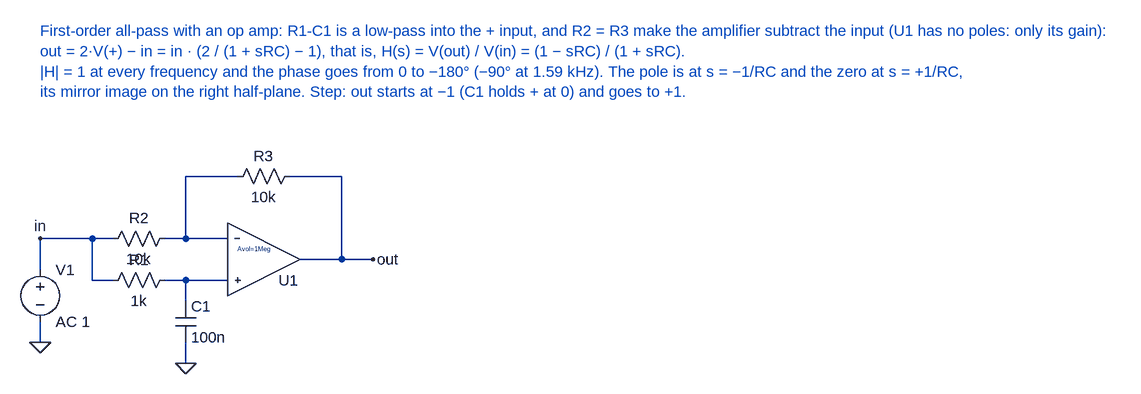
[diagram p0: schematic ap1.asc]
ap1.asc, the LTspice schematic file:
Version 4
SHEET 1 1200 800
WIRE 0 16 0 -32
WIRE 0 96 0 128
WIRE 0 -32 80 -32
WIRE 80 -32 112 -32
WIRE 192 -32 224 -32
WIRE 288 -32 224 -32
WIRE 224 -32 224 -128
WIRE 224 -128 304 -128
WIRE 384 -128 464 -128
WIRE 464 -128 464 0
WIRE 400 0 464 0
WIRE 464 0 512 0
WIRE 80 -32 80 32
WIRE 80 32 112 32
WIRE 192 32 224 32
WIRE 224 32 288 32
WIRE 224 32 224 64
WIRE 224 128 224 160
FLAG 0 128 0
FLAG 0 -32 in
FLAG 512 0 out
FLAG 224 160 0
SYMBOL voltage 0 0 R0
SYMATTR InstName V1
SYMATTR Value AC 1
SYMBOL res 208 -48 R90
WINDOW 0 0 56 VBottom 2
WINDOW 3 32 56 VTop 2
SYMATTR InstName R2
SYMATTR Value 10k
SYMBOL res 400 -144 R90
WINDOW 0 0 56 VBottom 2
WINDOW 3 32 56 VTop 2
SYMATTR InstName R3
SYMATTR Value 10k
SYMBOL OA_NoPole 480 -48 R0
SYMATTR InstName U1
SYMBOL res 208 16 R90
WINDOW 0 0 56 VBottom 2
WINDOW 3 32 56 VTop 2
SYMATTR InstName R1
SYMATTR Value 1k
SYMBOL cap 208 64 R0
SYMATTR InstName C1
SYMATTR Value 100n
TEXT 0 -352 Left 2 ;First-order all-pass with an op amp: R1-C1 is a low-pass into the + input, and R2 = R3 make the amplifier subtract the input (U1 has no poles: only its gain):\nout = 2·V(+) − in = in · (2 / (1 + sRC) − 1), that is, H(s) = V(out) / V(in) = (1 − sRC) / (1 + sRC).\n|H| = 1 at every frequency and the phase goes from 0 to −180° (−90° at 1.59 kHz). The pole is at s = −1/RC and the zero at s = +1/RC,\nits mirror image on the right half-plane. Step: out starts at −1 (C1 holds + at 0) and goes to +1.

The netlist it stands for:
* ap1.asc
V1 in 0 AC 1
R2 N001 in 10k
R3 out N001 10k
XU1 N002 N001 out OA_NoPole Avol=1Meg  ; pins In+ In- OUT
R1 N002 in 1k
C1 N002 0 100n
* First-order all-pass with an op amp: R1-C1 is a low-pass into the + input, and R2 = R3 make the amplifier subtract the input (U1 has no poles: only its gain):
* out = 2·V(+) − in = in · (2 / (1 + sRC) − 1), that is, H(s) = V(out) / V(in) = (1 − sRC) / (1 + sRC).
* |H| = 1 at every frequency and the phase goes from 0 to −180° (−90° at 1.59 kHz). The pole is at s = −1/RC and the zero at s = +1/RC,
* its mirror image on the right half-plane. Step: out starts at −1 (C1 holds + at 0) and goes to +1.
.lib OA_NoPole.sub
.backanno
.end